# Altium project FOC.PrjPcb
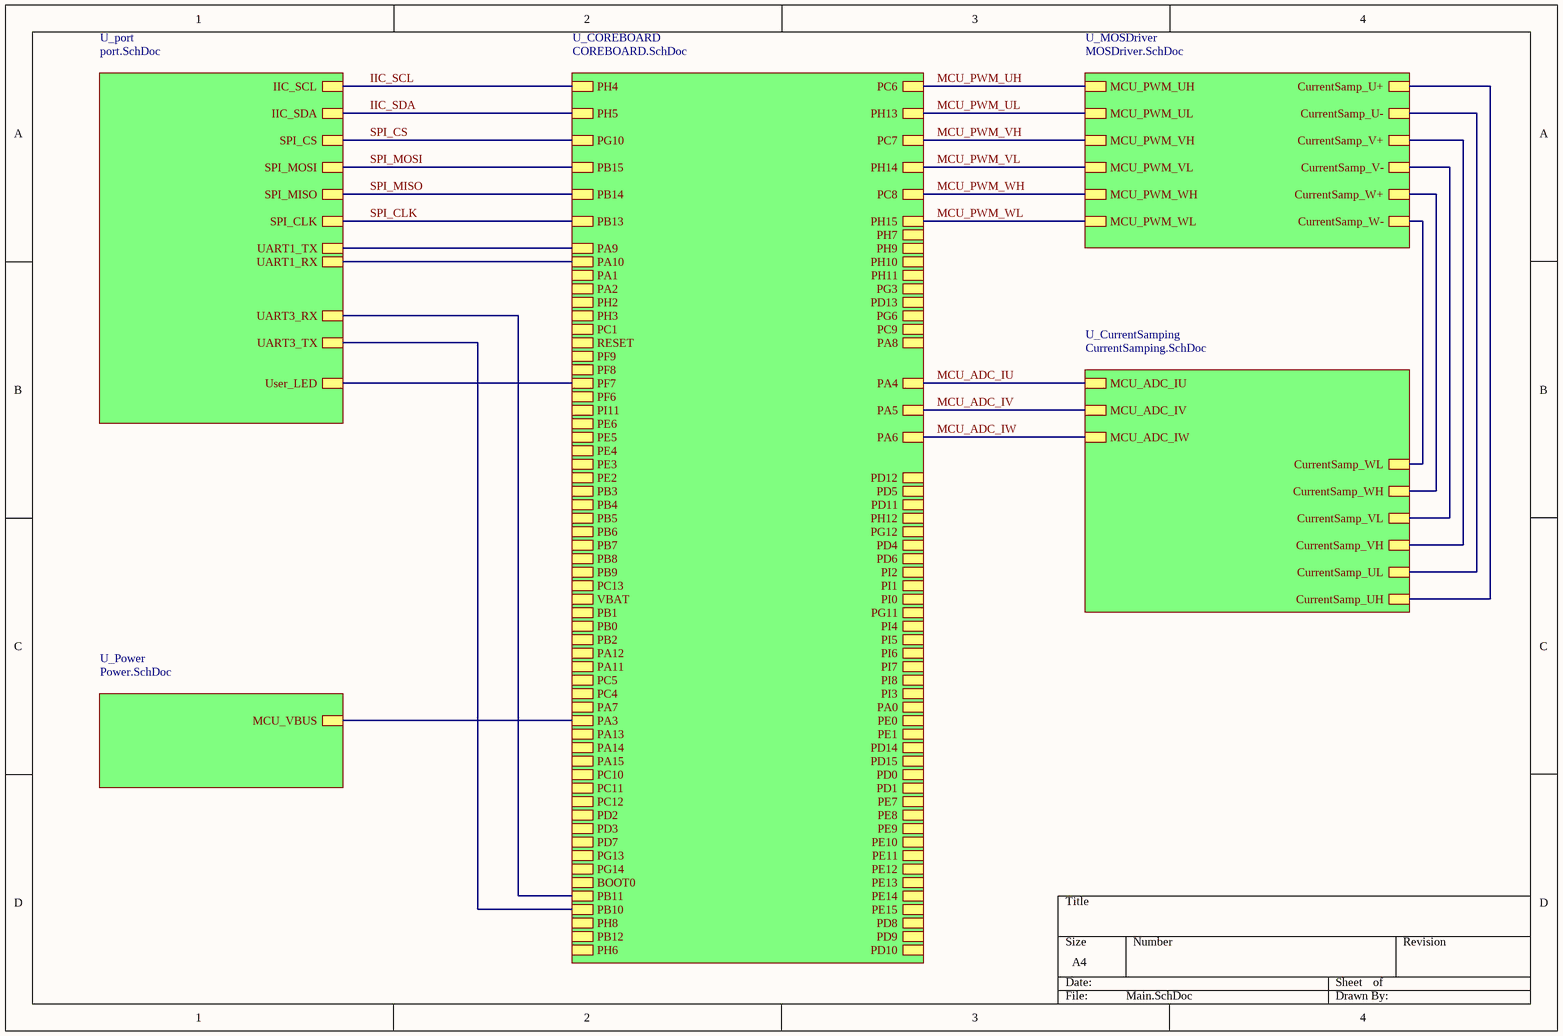
[diagram p0: Main.SchDoc]
6 sheets, 133 parts. Net scope: hierarchical (ports join the sheet entries above them; power ports are global).
Board file: FOC.PcbDoc
Sheets:
  Main.SchDoc
    U_CurrentSamping = CurrentSamping.SchDoc
    U_MOSDriver = MOSDriver.SchDoc
    U_port = port.SchDoc
    U_COREBOARD = COREBOARD.SchDoc
    U_Power = Power.SchDoc

## Sheet Main.SchDoc
size A4; SheetNumber: 1; SheetTotal: 6

### Sub-sheets
U_COREBOARD = COREBOARD.SchDoc: PA1, PA2, PH2, PH3, PH5, PH4, PC1, RESET, PF9, PF8, PF7, PF6, PI11, PE6, PE5, PE4, PE3, PE2, PB3, PB4, PB5, PB6, PB7, PB8, PB9, PC13, VBAT, PB1, PB0, PB2, PA12, PA11, PA10, PA9, PC5, PC4, PA7, PA6, PA5, PA4, PA3, PA13, PA14, PA15, PC10, PC11, PC12, PD2, PD3, PD7, PG10, PG13, PG14, BOOT0, PB11, PB10, PH8, PB12, PB13, PB14, PB15, PH6, PH7, PH9, PH10, PH11, PG3, PD13, PG6, PC6, PC7, PC8, PC9, PA8, PD12, PD5, PD11, PH12, PG12, PD4, PD6, PH15, PH14, PH13, PI2, PI1, PI0, PG11, PI4, PI5, PI6, PI7, PI8, PI3, PA0, PE0, PE1, PD14, PD15, PD0, PD1, PE7, PE8, PE9, PE10, PE11, PE12, PE13, PE14, PE15, PD8, PD9, PD10
U_CurrentSamping = CurrentSamping.SchDoc: CurrentSamp_UL, CurrentSamp_UH, MCU_ADC_IU, CurrentSamp_VL, CurrentSamp_VH, MCU_ADC_IV, CurrentSamp_WL, CurrentSamp_WH, MCU_ADC_IW
U_MOSDriver = MOSDriver.SchDoc: MCU_PWM_UH, MCU_PWM_VH, MCU_PWM_WH, MCU_PWM_UL, MCU_PWM_VL, MCU_PWM_WL, CurrentSamp_U+, CurrentSamp_U-, CurrentSamp_V+, CurrentSamp_V-, CurrentSamp_W+, CurrentSamp_W-
U_port = port.SchDoc: IIC_SCL, IIC_SDA, SPI_CS, SPI_MOSI, SPI_MISO, SPI_CLK, User_LED, UART1_RX, UART1_TX, UART3_RX, UART3_TX
U_Power = Power.SchDoc: MCU_VBUS

### Nets
IIC_SCL: sheet U_port/IIC_SCL, sheet U_COREBOARD/PH4
IIC_SDA: sheet U_port/IIC_SDA, sheet U_COREBOARD/PH5
MCU_ADC_IU: sheet U_CurrentSamping/MCU_ADC_IU, sheet U_COREBOARD/PA4
MCU_ADC_IV: sheet U_CurrentSamping/MCU_ADC_IV, sheet U_COREBOARD/PA5
MCU_ADC_IW: sheet U_CurrentSamping/MCU_ADC_IW, sheet U_COREBOARD/PA6
MCU_PWM_UH: sheet U_MOSDriver/MCU_PWM_UH, sheet U_COREBOARD/PC6
MCU_PWM_UL: sheet U_MOSDriver/MCU_PWM_UL, sheet U_COREBOARD/PH13
MCU_PWM_VH: sheet U_MOSDriver/MCU_PWM_VH, sheet U_COREBOARD/PC7
MCU_PWM_VL: sheet U_MOSDriver/MCU_PWM_VL, sheet U_COREBOARD/PH14
MCU_PWM_WH: sheet U_MOSDriver/MCU_PWM_WH, sheet U_COREBOARD/PC8
MCU_PWM_WL: sheet U_MOSDriver/MCU_PWM_WL, sheet U_COREBOARD/PH15
SPI_CLK: sheet U_port/SPI_CLK, sheet U_COREBOARD/PB13
SPI_CS: sheet U_port/SPI_CS, sheet U_COREBOARD/PG10
SPI_MISO: sheet U_port/SPI_MISO, sheet U_COREBOARD/PB14
SPI_MOSI: sheet U_port/SPI_MOSI, sheet U_COREBOARD/PB15
NetC27_1: sheet U_CurrentSamping/CurrentSamp_UL, sheet U_MOSDriver/CurrentSamp_U-
NetC27_2: sheet U_CurrentSamping/CurrentSamp_UH, sheet U_MOSDriver/CurrentSamp_U+
NetC28_1: sheet U_CurrentSamping/CurrentSamp_VL, sheet U_MOSDriver/CurrentSamp_V-
NetC28_2: sheet U_CurrentSamping/CurrentSamp_VH, sheet U_MOSDriver/CurrentSamp_V+
NetC29_1: sheet U_CurrentSamping/CurrentSamp_WH, sheet U_MOSDriver/CurrentSamp_W+
NetC29_2: sheet U_CurrentSamping/CurrentSamp_WL, sheet U_MOSDriver/CurrentSamp_W-
NetH1_2: sheet U_port/UART1_TX, sheet U_COREBOARD/PA9
NetH1_3: sheet U_port/UART1_RX, sheet U_COREBOARD/PA10
NetH2_2: sheet U_port/UART3_TX, sheet U_COREBOARD/PB10
NetH2_3: sheet U_port/UART3_RX, sheet U_COREBOARD/PB11
NetJ4_13: sheet U_port/User_LED, sheet U_COREBOARD/PF7
NetJ4_44: sheet U_COREBOARD/PA3, sheet U_Power/MCU_VBUS

## Sheet CurrentSamping.SchDoc
size A4; SheetNumber: 3; SheetTotal: 6
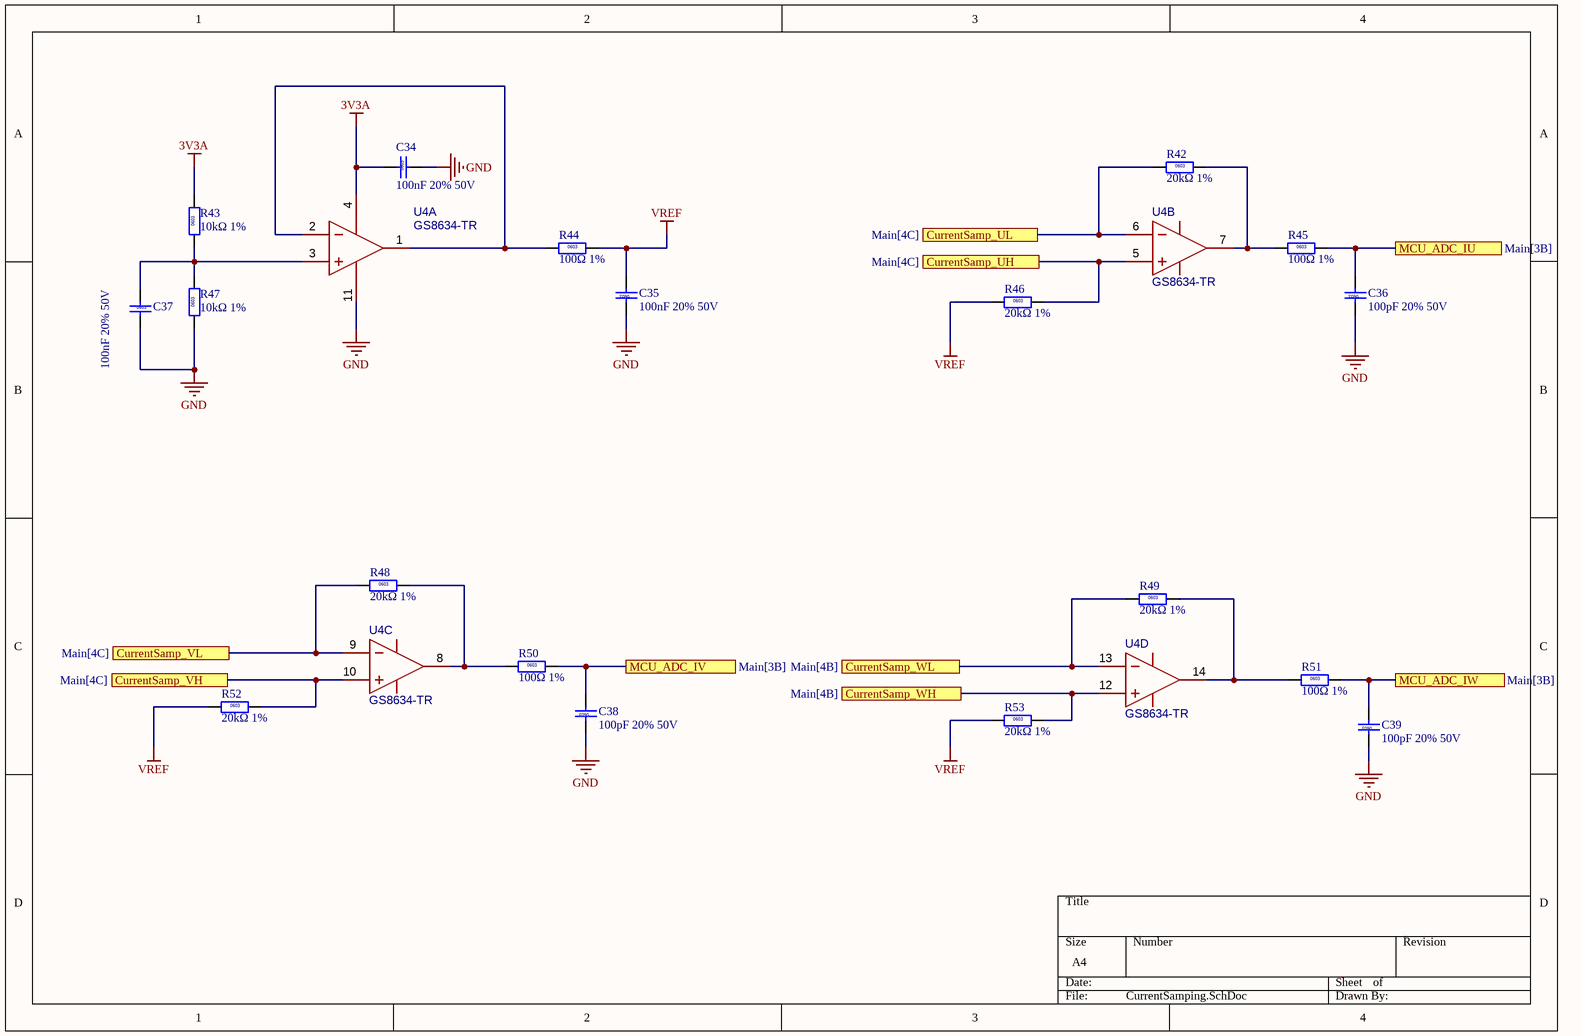
[diagram p1: CurrentSamping.SchDoc]

### Parts
C34  100nF 20% 50V  [C0603]
C35  100nF 20% 50V  [C0603]
C36  100pF 20% 50V  [C0603]
C37  100nF 20% 50V  [C0603]
C38  100pF 20% 50V  [C0603]
C39  100pF 20% 50V  [C0603]
R42  20kΩ 1%  [R0603]
R43  10kΩ 1%  [R0603]
R44  100Ω 1%  [R0603]
R45  100Ω 1%  [R0603]
R46  20kΩ 1%  [R0603]
R47  10kΩ 1%  [R0603]
R48  20kΩ 1%  [R0603]
R49  20kΩ 1%  [R0603]
R50  100Ω 1%  [R0603]
R51  100Ω 1%  [R0603]
R52  20kΩ 1%  [R0603]
R53  20kΩ 1%  [R0603]
U4  GS8634-TR  [SOP-14_L5.0-W4.4-P0.65-LS6.4-BL]  (parts A,B,C,D of 4)

### Ports
CurrentSamp_UH (see Main[4C]), CurrentSamp_UL (see Main[4C]), CurrentSamp_VH (see Main[4C]), CurrentSamp_VL (see Main[4C]), CurrentSamp_WH (see Main[4B]), CurrentSamp_WL (see Main[4B]), MCU_ADC_IU (see Main[3B]), MCU_ADC_IV (see Main[3B]), MCU_ADC_IW (see Main[3B])

### Nets
3V3A: C34.1 R43.2 U4.4(VDD)
GND: C34.2 C35.1 C36.1 C37.2 C38.1 C39.1 R47.1 U4.11(VSS)
VREF: C35.2 R44.2 R46.1 R52.1 R53.1
MCU_ADC_IU: C36.2 R45.2 ; port MCU_ADC_IU
MCU_ADC_IV: C38.2 R50.2 ; port MCU_ADC_IV
MCU_ADC_IW: C39.2 R51.2 ; port MCU_ADC_IW
NetC27_1: R42.1 U4.6(INB-) ; port CurrentSamp_UL
NetC27_2: R46.2 U4.5(INB+) ; port CurrentSamp_UH
NetC28_1: R48.1 U4.9(INC-) ; port CurrentSamp_VL
NetC28_2: R52.2 U4.10(INC+) ; port CurrentSamp_VH
NetC29_1: R53.2 U4.12(IND+) ; port CurrentSamp_WH
NetC29_2: R49.1 U4.13(IND-) ; port CurrentSamp_WL
NetC37_1: C37.1 R43.1 R47.2 U4.3(INA+)
NetR42_2: R42.2 R45.1 U4.7(OUTB)
NetR44_1: R44.1 U4.1(OUTA) U4.2(INA-)
NetR48_2: R48.2 R50.1 U4.8(OUTC)
NetR49_2: R49.2 R51.1 U4.14(OUTD)

### Notes on the sheet
- (in symbol C0603) 0603
- (in symbol R0603) 0603

### Library data of the parts
C34-C39 = C0603: 贴片电容; Package: C0603
R42-R53 = R0603: 贴片电阻; Package: R0603
U4 = GS8634-TR: 放大器数:4;轨到轨:轨到轨输入,轨到轨输出;增益带宽积(GBW):6MHz;输入失调电压(Vos):3.5mV;压摆率(SR):4.2V/us;输入偏置电流(Ib):1pA;; Manufacturer: Gainsil(聚洵); Relevance: []; AddInBom: yes; ModelId: 20b40d9ace5d4e70abc2a10921399e11聨0819f05c4eef4c71ace90d822a990e87; ModelName: SOP-14_L5.0-W4.4-H1.0-LS6.4-P0.65; ModelTransform: 236.714,196.85,0,90,0,0,0,0,0; Number of Channels: 4; Gain Bandwidth Product: 6MHz; Vos - Input Offset Voltage: 3.5mV; Input Offset Voltage Drift(Vos TC): 2.4uV/℃; Ib - Input Bias Current: 1pA; Input Voltage Noise Density: 13nV/√Hz@1kHz; Common Mode Rejection Ratio(CMRR): 90dB; Quiescent Current: 470uA; Output Current: 4mA; Single supply: 2.1V~5.5V; Dual Supply: 1.05V~2.75V；-2.75V~-1.05V; Symbol: GS8634-TR; Device: GS8634-TR; LCSC Part Name: 6MHz 轨到轨 I/O 输出，CMOS 运算放大器; SupplierPart: C157706; ManufacturerPart: GS8634-TR; Supplier Footprint: TSSOP-14; JLCPCB Part Class: Extended Part; Datasheet: https://item.szlcsc.com/datasheet/GS8634-TR/169054.html; Supplier: LCSC; ConvertToPcb: yes; FootprintName: SOP-14_L5.0-W4.4-P0.65-LS6.4-BL; Rail to Rail: 轨到轨输入,轨到轨输出; Slew Rate: 4.2V/us; Input Offset Current(Ios): 1pA; Operating Temperature: -40℃~+125℃; Features: 使能/关断功能

## Sheet MOSDriver.SchDoc
size A3; SheetNumber: 2; SheetTotal: 6
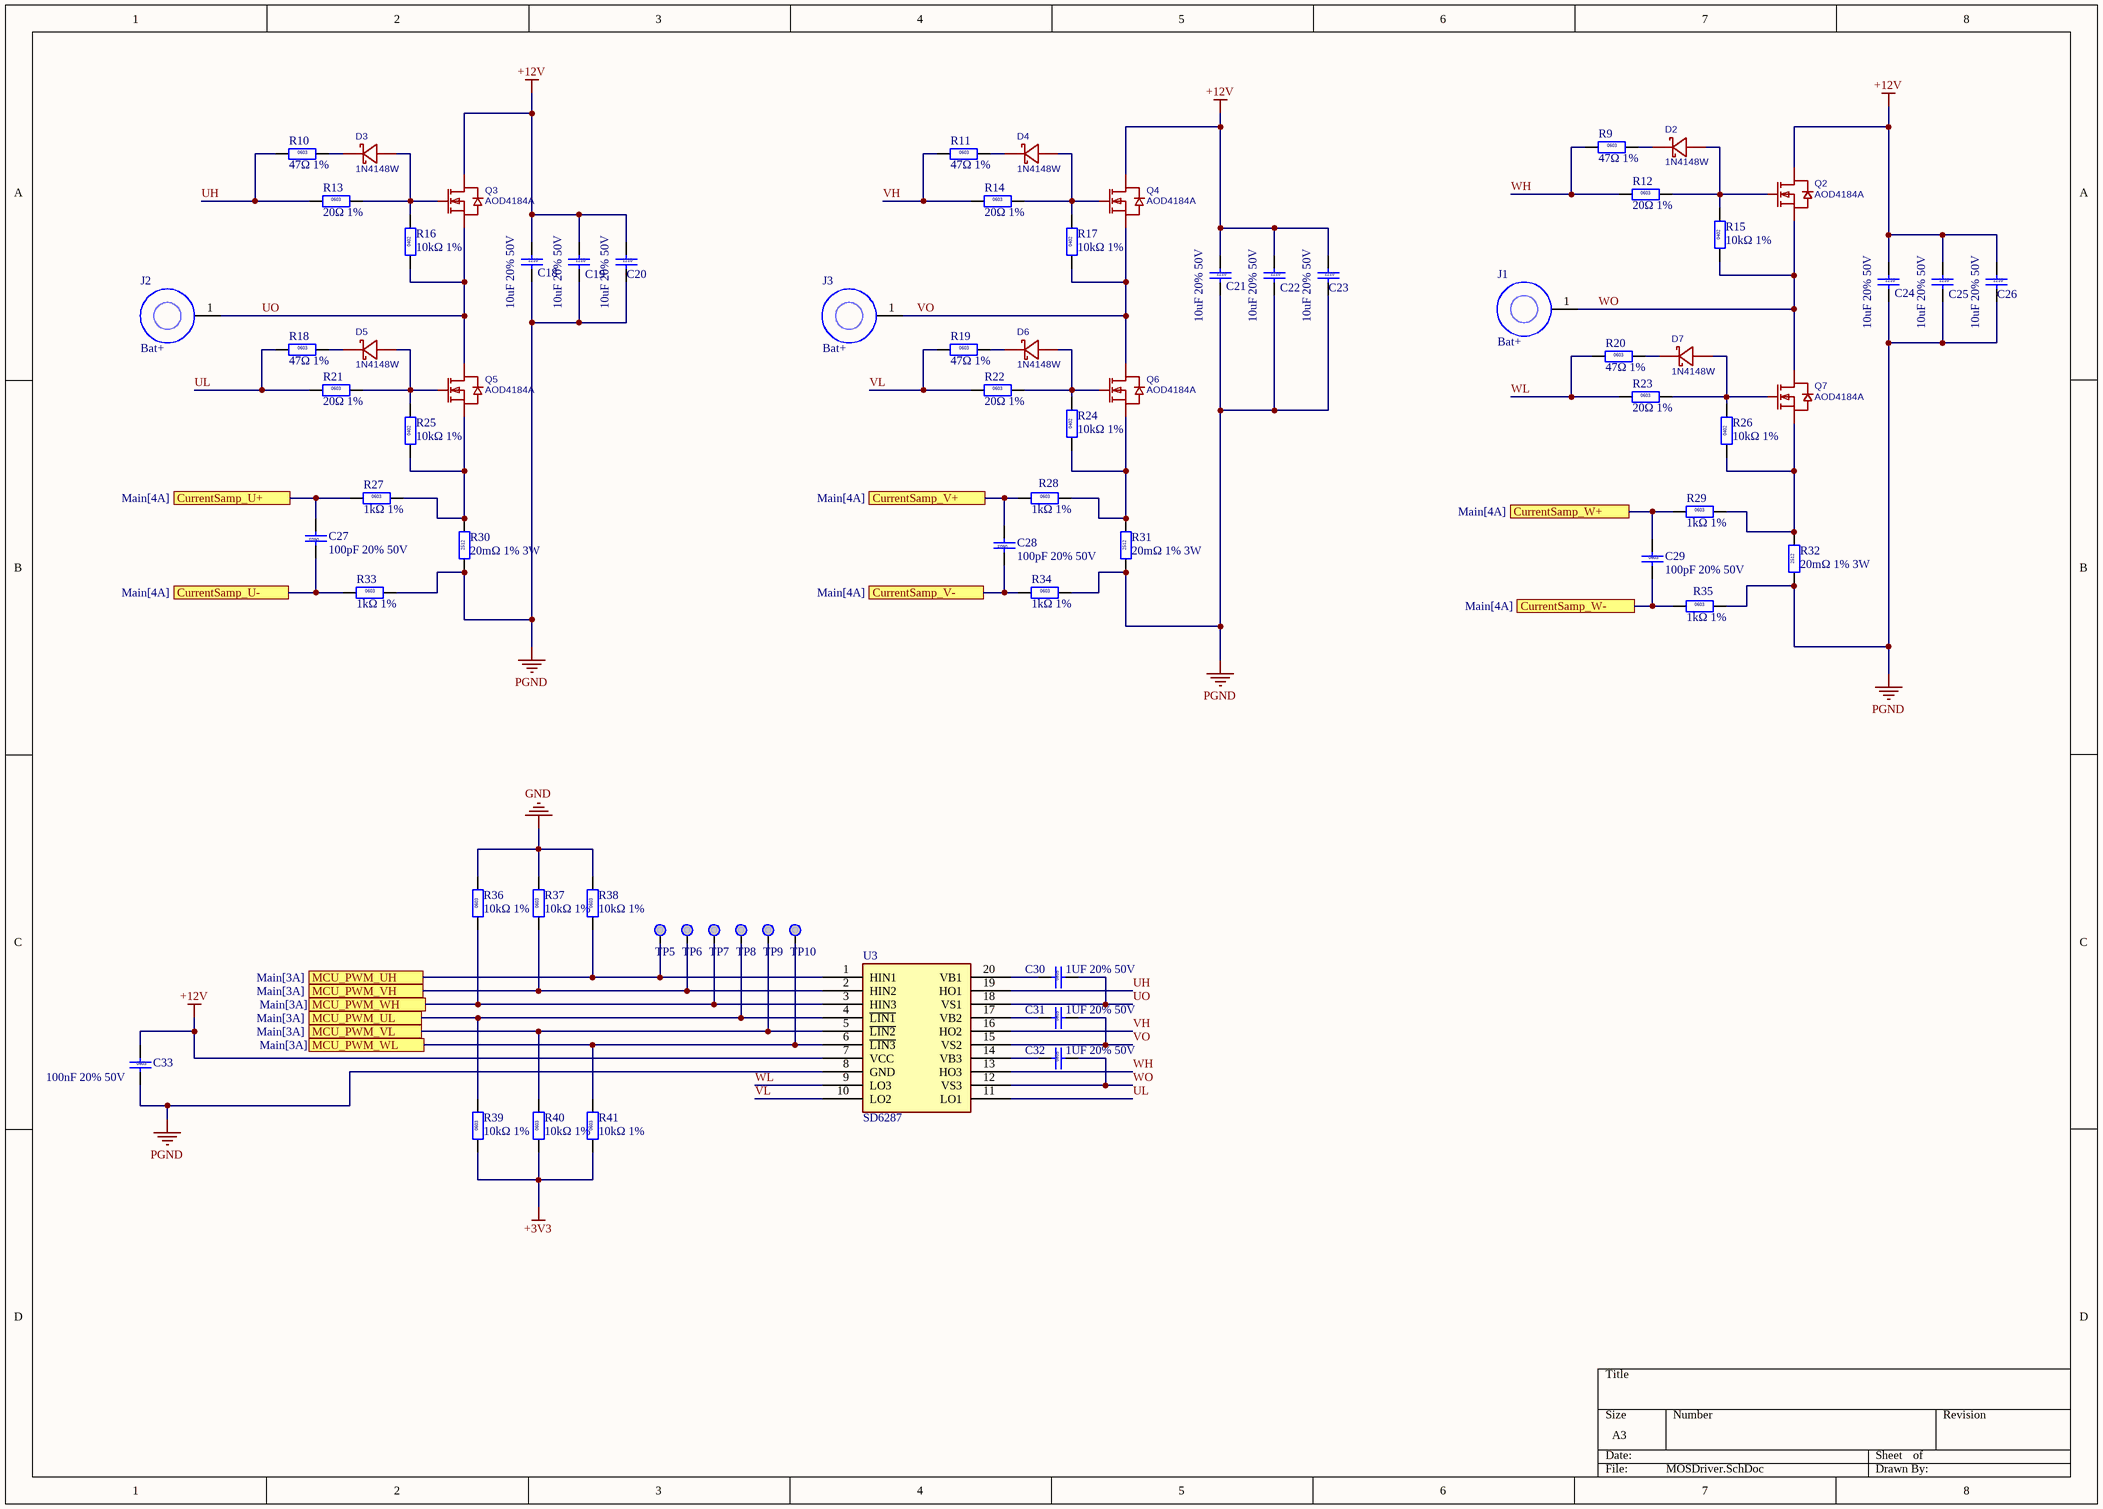
[diagram p2: MOSDriver.SchDoc]

### Parts
C18  10uF 20% 50V  [C1210]
C19  10uF 20% 50V  [C1210]
C20  10uF 20% 50V  [C1210]
C21  10uF 20% 50V  [C1210]
C22  10uF 20% 50V  [C1210]
C23  10uF 20% 50V  [C1210]
C24  10uF 20% 50V  [C1210]
C25  10uF 20% 50V  [C1210]
C26  10uF 20% 50V  [C1210]
C27  100pF 20% 50V  [C0603]
C28  100pF 20% 50V  [C0603]
C29  100pF 20% 50V  [C0603]
C30  1UF 20% 50V  [C0805]
C31  1UF 20% 50V  [C0805]
C32  1UF 20% 50V  [C0805]
C33  100nF 20% 50V  [C0603]
D2  1N4148W  [SOD-123_L2.7-W1.6-LS3.7-FD]
D3  1N4148W  [SOD-123_L2.7-W1.6-LS3.7-FD]
D4  1N4148W  [SOD-123_L2.7-W1.6-LS3.7-FD]
D5  1N4148W  [SOD-123_L2.7-W1.6-LS3.7-FD]
D6  1N4148W  [SOD-123_L2.7-W1.6-LS3.7-FD]
D7  1N4148W  [SOD-123_L2.7-W1.6-LS3.7-FD]
J1  Bat+  [VIAD1.8M1.3MM]
J2  Bat+  [VIAD1.8M1.3MM]
J3  Bat+  [VIAD1.8M1.3MM]
Q2  AOD4184A  [TO-252-2_L6.6-W6.1-P4.57-LS9.9-TL-CW]
Q3  AOD4184A  [TO-252-2_L6.6-W6.1-P4.57-LS9.9-TL-CW]
Q4  AOD4184A  [TO-252-2_L6.6-W6.1-P4.57-LS9.9-TL-CW]
Q5  AOD4184A  [TO-252-2_L6.6-W6.1-P4.57-LS9.9-TL-CW]
Q6  AOD4184A  [TO-252-2_L6.6-W6.1-P4.57-LS9.9-TL-CW]
Q7  AOD4184A  [TO-252-2_L6.6-W6.1-P4.57-LS9.9-TL-CW]
R9  47Ω 1%  [R0603]
R10  47Ω 1%  [R0603]
R11  47Ω 1%  [R0603]
R12  20Ω 1%  [R0603]
R13  20Ω 1%  [R0603]
R14  20Ω 1%  [R0603]
R15  10kΩ 1%  [R0402]
R16  10kΩ 1%  [R0402]
R17  10kΩ 1%  [R0402]
R18  47Ω 1%  [R0603]
R19  47Ω 1%  [R0603]
R20  47Ω 1%  [R0603]
R21  20Ω 1%  [R0603]
R22  20Ω 1%  [R0603]
R23  20Ω 1%  [R0603]
R24  10kΩ 1%  [R0402]
R25  10kΩ 1%  [R0402]
R26  10kΩ 1%  [R0402]
R27  1kΩ 1%  [R0603]
R28  1kΩ 1%  [R0603]
R29  1kΩ 1%  [R0603]
R30  20mΩ 1% 3W  [R2512]
R31  20mΩ 1% 3W  [R2512]
R32  20mΩ 1% 3W  [R2512]
R33  1kΩ 1%  [R0603]
R34  1kΩ 1%  [R0603]
R35  1kΩ 1%  [R0603]
R36  10kΩ 1%  [R0603]
R37  10kΩ 1%  [R0603]
R38  10kΩ 1%  [R0603]
R39  10kΩ 1%  [R0603]
R40  10kΩ 1%  [R0603]
R41  10kΩ 1%  [R0603]
TP5  TestPoint  [TP-40]  (value not drawn)  (no BOM)
TP6  TestPoint  [TP-40]  (value not drawn)  (no BOM)
TP7  TestPoint  [TP-40]  (value not drawn)  (no BOM)
TP8  TestPoint  [TP-40]  (value not drawn)  (no BOM)
TP9  TestPoint  [TP-40]  (value not drawn)  (no BOM)
TP10  TestPoint  [TP-40]  (value not drawn)  (no BOM)
U3  SD6287  [TSSOP-20]

### Ports
CurrentSamp_U+ (see Main[4A]), CurrentSamp_U- (see Main[4A]), CurrentSamp_V+ (see Main[4A]), CurrentSamp_V- (see Main[4A]), CurrentSamp_W+ (see Main[4A]), CurrentSamp_W- (see Main[4A]), MCU_PWM_UH (see Main[3A]), MCU_PWM_UL (see Main[3A]), MCU_PWM_VH (see Main[3A]), MCU_PWM_VL (see Main[3A]), MCU_PWM_WH (see Main[3A]), MCU_PWM_WL (see Main[3A])

### Nets
+3V3: R39.1 R40.1 R41.1
+12V: C18.1 C19.1 C20.1 C21.1 C22.1 C23.1 C24.1 C25.1 C26.1 C33.1 Q2.2(D) Q3.2(D) Q4.2(D) U3.7(VCC)
GND: R36.2 R37.2 R38.2
PGND: C18.2 C19.2 C20.2 C21.2 C22.2 C23.2 C24.2 C25.2 C26.2 C33.2 R30.1 R31.1 R32.1 R33.2 R34.2 R35.2 U3.8(GND)
MCU_PWM_UH: R38.1 TP5.1 U3.1(HIN1) ; port MCU_PWM_UH
MCU_PWM_UL: R39.2 TP8.1 U3.4(~{LIN1}) ; port MCU_PWM_UL
MCU_PWM_VH: R37.1 TP6.1 U3.2(HIN2) ; port MCU_PWM_VH
MCU_PWM_VL: R40.2 TP9.1 U3.5(~{LIN2}) ; port MCU_PWM_VL
MCU_PWM_WH: R36.1 TP7.1 U3.3(HIN3) ; port MCU_PWM_WH
MCU_PWM_WL: R41.2 TP10.1 U3.6(~{LIN3}) ; port MCU_PWM_WL
UH: R10.1 R13.1 U3.19(HO1)
UL: R18.1 R21.1 U3.11(LO1)
UO: C30.2 J2.1 Q3.3(S) Q5.2(D) R16.1 U3.18(VS1)
VH: R11.1 R14.1 U3.16(HO2)
VL: R19.1 R22.1 U3.10(LO2)
VO: C31.2 J3.1 Q4.3(S) Q6.2(D) R17.1 U3.15(VS2)
WH: R9.1 R12.1 U3.13(HO3)
WL: R20.1 R23.1 U3.9(LO3)
WO: C32.2 J1.1 Q2.3(S) Q7.2(D) R15.1 U3.12(VS3)
NetC27_1: C27.1 R33.1 ; port CurrentSamp_U-
NetC27_2: C27.2 R27.1 ; port CurrentSamp_U+
NetC28_1: C28.1 R34.1 ; port CurrentSamp_V-
NetC28_2: C28.2 R28.1 ; port CurrentSamp_V+
NetC29_1: C29.1 R29.1 ; port CurrentSamp_W+
NetC29_2: C29.2 R35.1 ; port CurrentSamp_W-
NetC30_1: C30.1 U3.20(VB1)
NetC31_1: C31.1 U3.17(VB2)
NetC32_1: C32.1 U3.14(VB3)
NetD2_1: D2.1(A) Q2.1(G) R12.2 R15.2
NetD2_2: D2.2(K) R9.2
NetD3_1: D3.1(A) Q3.1(G) R13.2 R16.2
NetD3_2: D3.2(K) R10.2
NetD4_1: D4.1(A) Q4.1(G) R14.2 R17.2
NetD4_2: D4.2(K) R11.2
NetD5_1: D5.1(A) Q5.1(G) R21.2 R25.2
NetD5_2: D5.2(K) R18.2
NetD6_1: D6.1(A) Q6.1(G) R22.2 R24.2
NetD6_2: D6.2(K) R19.2
NetD7_1: D7.1(A) Q7.1(G) R23.2 R26.2
NetD7_2: D7.2(K) R20.2
NetQ5_3: Q5.3(S) R25.1 R27.2 R30.2
NetQ6_3: Q6.3(S) R24.1 R28.2 R31.2
NetQ7_3: Q7.3(S) R26.1 R29.2 R32.2

### Notes on the sheet
- (in symbol C0603) 0603
- (in symbol C0805) 0805
- (in symbol R0603) 0603
- (in symbol R2512) 2512

### Library data of the parts
C18-C26 = C1210: 贴片电容; Package: 1210
C27-C29 C33 = C0603: 贴片电容; Package: C0603
C30-C32 = C0805: 贴片电容; Package: C0805
D2-D7 = 1N4148W_C7420318: 二极管配置:独立式;整流电流:150mA;直流反向耐压(Vr):100V;正向压降(Vf):1.25V@150mA;反向恢复时间(Trr):4ns;; Manufacturer: R+O(宏嘉诚); AddInBom: yes; ModelId: 5054d9b7be8b429dad093a54b517b4dd聨0819f05c4eef4c71ace90d822a990e87; ModelTransform: 145.669,61.024,0,0,0,0,0,0,0; Diode Configuration: 独立式; Pd - Power Dissipation: 400mW; Current - Rectified: 150mA; Voltage - DC Reverse(Vr): 100V; Non-Repetitive Peak Forward Surge Current: 2A; Reverse Leakage Current (Ir): 1uA@75V; Reverse Recovery Time (trr): 4ns; Operating Junction Temperature Range: -55℃~+150℃; Symbol: 1N4148W_C7420318; Device: 1N4148W_C7420318; LCSC Part Name: 100V 150mA; SupplierPart: C7420318; ManufacturerPart: 1N4148W; Supplier Footprint: SOD-123; JLCPCB Part Class: Extended Part; Datasheet: https://item.szlcsc.com/datasheet/1N4148W/8397140.html; Supplier: LCSC; ConvertToPcb: yes; FootprintName: SOD-123_L2.7-W1.6-LS3.7-FD; ModelName: SOD-123_L2.7-W1.6-LS3.7-FD; Voltage - Forward(Vf@If): 1.25V@150mA
J1-J3 = VIAHole: 通用过孔; Notepad: *
Q2-Q7 = AOD4184A: 数量:1个N沟道;漏源电压(Vdss):40V;连续漏极电流(Id):13A；50A;导通电阻(RDS(on)):7mΩ@10V;耗散功率(Pd):2.3W；50W;阈值电压(Vgs(th)):2.6V;; Manufacturer: AOS; AddInBom: yes; ModelId: ce57f84d66384067af8a68020b6de06d聨0819f05c4eef4c71ace90d822a990e87; ModelName: TO-252-2L-3P_L6.6-W6.1-H2.3-LS10.1-P4.6; ModelTransform: 259.842,390.52442,0,270,0,0,38.027,-0.598,0; Number: 1个N沟道; Drain to Source Voltage: 40V; Gate Threshold Voltage (Vgs(th)): 2.6V; Gate Charge(Qg): 33nC@10V; Input Capacitance(Ciss): 1.8nF; Reverse Transfer Capacitance (Crss@Vds): 135pF; Type: N沟道; Output Capacitance(Coss): 215pF; Vgs: ±20V; Symbol: AOD4184A; Device: AOD4184A; LCSC Part Name: 1个N沟道 耐压:40V 电流:13A 50A; SupplierPart: C99124; ManufacturerPart: AOD4184A; Supplier Footprint: TO-252; JLCPCB Part Class: Extended Part; Datasheet: https://item.szlcsc.com/datasheet/AOD4184A/100337.html; Supplier: LCSC; ConvertToPcb: yes; FootprintName: TO-252-2_L6.6-W6.1-P4.57-LS9.9-TL-CW; Current - Continuous Drain(Id): 13A；50A; RDS(on): 7mΩ@10V; Pd - Power Dissipation: 2.3W；50W; Operating Temperature: -55℃~+175℃; Configuration: -
R9-R14 R18-R23 R27-R29 R33-R41 = R0603: 贴片电阻; Package: R0603
R15-R17 R24-R26 = R0402: 贴片电阻; Package: 0402
R30-R32 = R2512: 贴片电阻; Package: R2512
TP5-TP10 = TestPoint: Test Point
U3 = SD6287: 三相独立半桥驱动芯片; Notepad: 扩展库; Package: TSSOP-20_4.4x6.5x0.65P

## Sheet port.SchDoc
size A4; SheetNumber: 4; SheetTotal: 6
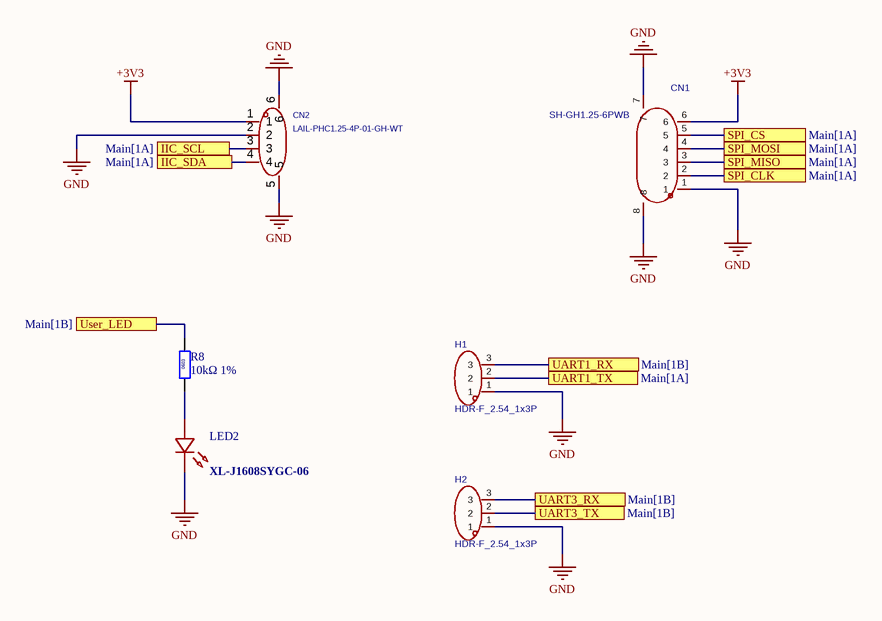
[diagram p3: port.SchDoc]

### Parts
CN1  SH-GH1.25-6PWB  [SW-SMD_SH-GH1.25-6PWB]
CN2  LAIL-PHC1.25-4P-01-GH-WT  [CONN-SMD_4P-P1.25_HCTL_HC-GH-4PWTKK]
H1  HDR-F_2.54_1x3P  [HDR-TH_3P-P2.54-V-F]
H2  HDR-F_2.54_1x3P  [HDR-TH_3P-P2.54-V-F]
LED2  XL-J1608SYGC-06  [LED0603-FD_GREEN]
R8  10kΩ 1%  [R0603]

### Ports
IIC_SCL (see Main[1A]), IIC_SDA (see Main[1A]), SPI_CLK (see Main[1A]), SPI_CS (see Main[1A]), SPI_MISO (see Main[1A]), SPI_MOSI (see Main[1A]), UART1_RX (see Main[1B]), UART1_TX (see Main[1A]), UART3_RX (see Main[1B]), UART3_TX (see Main[1B]), User_LED (see Main[1B])

### Nets
+3V3: CN1.6 CN2.1
GND: CN1.1 CN1.7 CN1.8 CN2.2 CN2.5 CN2.6 H1.1 H2.1 LED2.2(C)
IIC_SCL: CN2.3 ; port IIC_SCL
IIC_SDA: CN2.4 ; port IIC_SDA
SPI_CLK: CN1.2 ; port SPI_CLK
SPI_CS: CN1.5 ; port SPI_CS
SPI_MISO: CN1.3 ; port SPI_MISO
SPI_MOSI: CN1.4 ; port SPI_MOSI
NetH1_2: H1.2 ; port UART1_TX
NetH1_3: H1.3 ; port UART1_RX
NetH2_2: H2.2 ; port UART3_TX
NetH2_3: H2.3 ; port UART3_RX
NetJ4_13: R8.2 ; port User_LED
NetLED2_1: LED2.1(A) R8.1

### Notes on the sheet
- (in symbol R0603) 0603

### Library data of the parts
CN1 = SH-GH1.25-6PWB: 插针结构:1x6P;间距:1.25mm;安装方式:卧贴;参考系列:GH;总PIN数:6P;排数:1;每排PIN数:6;行距:-;额定电流:1A;触头材质:磷青铜;触头镀层:锡;工作温度:-25℃~+85℃;; Manufacturer: SHOU HAN(首韩); AddInBom: yes; ModelId: e09572dfa6674d54b7c86450513a2389聨0819f05c4eef4c71ace90d822a990e87; ModelTransform: 423.6212,188.976,0,0,0,0,0.001,-12.675,0; Pins Structure: 1x6P; Pitch: 1.25mm; Reference Series: GH; Number of PINs Per Row: 6; Current Rating: 1A; Voltage Rating: 125V; Plastic Material: LCP; Flame Retardant Rating: UL94V-0; Symbol: SH-GH1.25-6PWB; Device: SH-GH1.25-6PWB; LCSC Part Name: 米色 1x6P 间距:1.25mm 卧贴 系列:GH; SupplierPart: C42372473; ManufacturerPart: SH-GH1.25-6PWB; Supplier Footprint: SMD,P=1.25mm,卧贴; JLCPCB Part Class: Extended Part; Datasheet: https://item.szlcsc.com/datasheet/SH-GH1.25-6PWB/44255911.html; Supplier: LCSC; ConvertToPcb: yes; FootprintName: SW-SMD_SH-GH1.25-6PWB; ModelName: SW-SMD_SH-GH1.25-6PWB; Mounting Type: 卧贴; Number of Pins: 6P; Number of Rows: 1; Row Spacing: -; Contact Material: 磷青铜; Contact Plating: 锡; Operating Temperature: -25℃~+85℃; Supplementary Features: -; Color: 米色
CN2 = LAIL-PHC1.25-4P-01-GH-WT: 插针结构:1x4P;间距:1.25mm;安装方式:卧贴;参考系列:GH;总PIN数:4P;排数:1;每排PIN数:4;额定电流:1A;触头材质:磷青铜;触头镀层:锡;工作温度:-25℃~+85℃;; Manufacturer: LAILAN(莱联); AddInBom: yes; ModelId: be1f9715b107443eaa221cf46be59155聨0819f05c4eef4c71ace90d822a990e87; ModelTransform: 326.771,190.9445,0,0,0,0,0,-8.858,0; Pins Structure: 1x4P; Pitch: 1.25mm; Reference Series: GH; Number of PINs Per Row: 4; Current Rating: 1A; Voltage Rating: 50V; Plastic Material: LCP; Flame Retardant Rating: UL94V-0; Supplementary Features: 辅助焊脚; Z-Height of the Board: 4.4mm; X-Length of Bottom Edge on Board (Spacing Line): 8.25mm; Y-Width of Bottom Edge on Board: 4.9mm; Symbol: LAIL-PHC1.25-4P-01-GH-WT; Device: LAIL-PHC1.25-4P-01-GH-WT; LCSC Part Name: 1x4P 间距:1.25mm 卧贴 系列:GH; SupplierPart: C54905900; ManufacturerPart: LAIL-PHC1.25-4P-01-GH-WT; Supplier Footprint: SMD,P=1.25mm,卧贴; JLCPCB Part Class: Extended Part; Datasheet: https://item.szlcsc.com/datasheet/LAIL-PHC1.25-4P-01-GH-WT/58431077.html; Supplier: LCSC; ConvertToPcb: yes; FootprintName: CONN-SMD_4P-P1.25_HCTL_HC-GH-4PWTKK; ModelName: CONN-SMD_4P-P1.25_HCTL_HC-GH-4PWTKK; Mounting Type: 卧贴; Number of Pins: 4P; Number of Rows: 1; Contact Material: 磷青铜; Contact Plating: 锡; Operating Temperature: -25℃~+85℃; Color: 米黄色
H1 H2 = HDR-F_2.54_1x3P: Symbol: PM254V-11-03-H85; ConvertToPcb: yes; ModelId: f3b3cc5aae9641bf9e56fc160cef875b聨0819f05c4eef4c71ace90d822a990e87; ModelName: HDR2.54-F-LI-1X3P; ModelTransform: 299.9994,100,0,0,0,0,0,0,-118.11; Device: HDR-F_2.54_1x3P; AddInBom: yes; SupplierPart: C541850; Supplier Footprint: 插件; FootprintName: HDR-TH_3P-P2.54-V-F
LED2 = LED_0603_G: 灯头类型:1.6mmx0.8mm方形灯头;发光颜色:黄绿色;正向压降(Vf):1.9V~2.1V;功率:60mW;正向电流:20mA;波长:565nm~575nm;二极管配置:独立二极管;透镜颜色:无色透明透镜;色温:-;发光强度:80mcd;发光角度:120°;载带方式:-;工作温度:-40℃~+85℃;; Manufacturer: XINGLIGHT(成兴光); AddInBom: yes; ModelId: 1ce04384e8434edd9926301526d5d892聨0819f05c4eef4c71ace90d822a990e87; ModelTransform: 62.992,31.8897,0,0,0,0,0,0,0; Illumination Color: 黄绿色; Power(Watts): 60mW; Forward Current: 20mA; Peak Wavelength: 570nm; Diode Configuration: 独立二极管; Lens Color: 无色透明透镜; Luminous Intensity: 80mcd; Viewing Angle: 120°; Symbol: XL-J1608SYGC-06; Device: XL-J1608SYGC-06; LCSC Part Name: 0603普绿0.6T（金版）; SupplierPart: C48586672; ManufacturerPart: XL-J1608SYGC-06; Supplier Footprint: SMD; JLCPCB Part Class: Extended Part; Datasheet: https://item.szlcsc.com/datasheet/XL-J1608SYGC-06/50855282.html; Supplier: LCSC; ConvertToPcb: yes; FootprintName: LED0603-FD_GREEN; ModelName: LED0603-FD_GREEN; Lamp Holder Type: 1.6mmx0.8mm方形灯头; Voltage - Forward(Vf): 1.9V~2.1V; Wavelength - Dominant: 565nm~575nm; Color Temperature: -; Mounting Style: -; Operating Temperature: -40℃~+85℃
R8 = R0603: 贴片电阻; Package: R0603

## Sheet COREBOARD.SchDoc
size A4; SheetNumber: 6; SheetTotal: 6
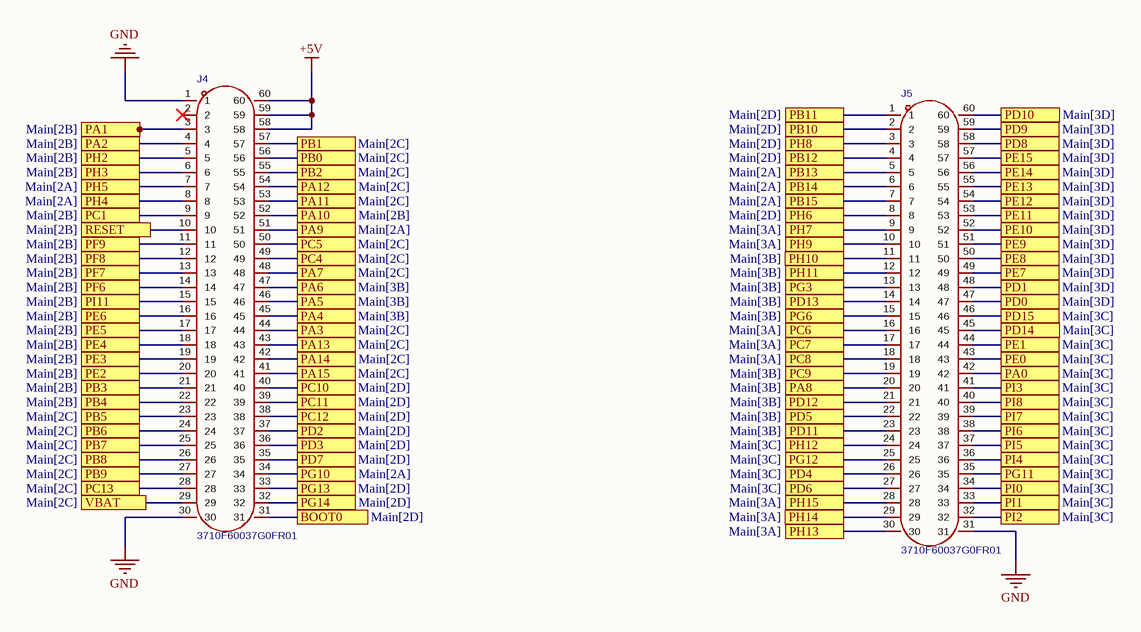
[diagram p4: COREBOARD.SchDoc]

### Parts
J4  3710F60037G0FR01  [CONN-TH_60P-P0.80_3710F60037G0FR01]
J5  3710F60037G0FR01  [CONN-TH_60P-P0.80_3710F60037G0FR01]

### Ports
BOOT0 (see Main[2D]), PA0 (see Main[3C]), PA1 (see Main[2B]), PA2 (see Main[2B]), PA3 (see Main[2C]), PA4 (see Main[3B]), PA5 (see Main[3B]), PA6 (see Main[3B]), PA7 (see Main[2C]), PA8 (see Main[3B]), PA9 (see Main[2A]), PA10 (see Main[2B]), PA11 (see Main[2C]), PA12 (see Main[2C]), PA13 (see Main[2C]), PA14 (see Main[2C]), PA15 (see Main[2C]), PB0 (see Main[2C]), PB1 (see Main[2C]), PB2 (see Main[2C]), PB3 (see Main[2B]), PB4 (see Main[2B]), PB5 (see Main[2C]), PB6 (see Main[2C]), PB7 (see Main[2C]), PB8 (see Main[2C]), PB9 (see Main[2C]), PB10 (see Main[2D]), PB11 (see Main[2D]), PB12 (see Main[2D]), PB13 (see Main[2A]), PB14 (see Main[2A]), PB15 (see Main[2A]), PC1 (see Main[2B]), PC4 (see Main[2C]), PC5 (see Main[2C]), PC6 (see Main[3A]), PC7 (see Main[3A]), PC8 (see Main[3A]), PC9 (see Main[3B]), PC10 (see Main[2D]), PC11 (see Main[2D]), PC12 (see Main[2D]), PC13 (see Main[2C]), PD0 (see Main[3D]), PD1 (see Main[3D]), PD2 (see Main[2D]), PD3 (see Main[2D]), PD4 (see Main[3C]), PD5 (see Main[3B]), PD6 (see Main[3C]), PD7 (see Main[2D]), PD8 (see Main[3D]), PD9 (see Main[3D]), PD10 (see Main[3D]), PD11 (see Main[3B]), PD12 (see Main[3B]), PD13 (see Main[3B]), PD14 (see Main[3C]), PD15 (see Main[3C]), PE0 (see Main[3C]), PE1 (see Main[3C]), PE2 (see Main[2B]), PE3 (see Main[2B]), PE4 (see Main[2B]), PE5 (see Main[2B]), PE6 (see Main[2B]), PE7 (see Main[3D]), PE8 (see Main[3D]), PE9 (see Main[3D]), PE10 (see Main[3D]), PE11 (see Main[3D]), PE12 (see Main[3D]), PE13 (see Main[3D]), PE14 (see Main[3D]), PE15 (see Main[3D]), PF6 (see Main[2B]), PF7 (see Main[2B]), PF8 (see Main[2B]), PF9 (see Main[2B]), PG3 (see Main[3B]), PG6 (see Main[3B]), PG10 (see Main[2A]), PG11 (see Main[3C]), PG12 (see Main[3C]), PG13 (see Main[2D]), PG14 (see Main[2D]), PH2 (see Main[2B]), PH3 (see Main[2B]), PH4 (see Main[2A]), PH5 (see Main[2A]), PH6 (see Main[2D]), PH7 (see Main[3A]), PH8 (see Main[2D]), PH9 (see Main[3A]), PH10 (see Main[3B]), PH11 (see Main[3B]), PH12 (see Main[3C]), PH13 (see Main[3A]), PH14 (see Main[3A]), PH15 (see Main[3A]), PI0 (see Main[3C]), PI1 (see Main[3C]), PI2 (see Main[3C]), PI3 (see Main[3C]), PI4 (see Main[3C]), PI5 (see Main[3C]), PI6 (see Main[3C]), PI7 (see Main[3C]), PI8 (see Main[3C]), PI11 (see Main[2B]), RESET (see Main[2B]), VBAT (see Main[2C])

### Nets
+5V: J4.58 J4.59 J4.60
GND: J4.1 J4.30 J5.31
IIC_SCL: J4.8 ; port PH4
IIC_SDA: J4.7 ; port PH5
MCU_ADC_IU: J4.45 ; port PA4
MCU_ADC_IV: J4.46 ; port PA5
MCU_ADC_IW: J4.47 ; port PA6
MCU_PWM_UH: J5.16 ; port PC6
MCU_PWM_UL: J5.30 ; port PH13
MCU_PWM_VH: J5.17 ; port PC7
MCU_PWM_VL: J5.29 ; port PH14
MCU_PWM_WH: J5.18 ; port PC8
MCU_PWM_WL: J5.28 ; port PH15
SPI_CLK: J5.5 ; port PB13
SPI_CS: J4.34 ; port PG10
SPI_MISO: J5.6 ; port PB14
SPI_MOSI: J5.7 ; port PB15
NetH1_2: J4.51 ; port PA9
NetH1_3: J4.52 ; port PA10
NetH2_2: J5.2 ; port PB10
NetH2_3: J5.1 ; port PB11
NetJ4_3: J4.3 ; port PA1
NetJ4_4: J4.4 ; port PA2
NetJ4_5: J4.5 ; port PH2
NetJ4_6: J4.6 ; port PH3
NetJ4_9: J4.9 ; port PC1
NetJ4_10: J4.10 ; port RESET
NetJ4_11: J4.11 ; port PF9
NetJ4_12: J4.12 ; port PF8
NetJ4_13: J4.13 ; port PF7
NetJ4_14: J4.14 ; port PF6
NetJ4_15: J4.15 ; port PI11
NetJ4_16: J4.16 ; port PE6
NetJ4_17: J4.17 ; port PE5
NetJ4_18: J4.18 ; port PE4
NetJ4_19: J4.19 ; port PE3
NetJ4_20: J4.20 ; port PE2
NetJ4_21: J4.21 ; port PB3
NetJ4_22: J4.22 ; port PB4
NetJ4_23: J4.23 ; port PB5
NetJ4_24: J4.24 ; port PB6
NetJ4_25: J4.25 ; port PB7
NetJ4_26: J4.26 ; port PB8
NetJ4_27: J4.27 ; port PB9
NetJ4_28: J4.28 ; port PC13
NetJ4_29: J4.29 ; port VBAT
NetJ4_31: J4.31 ; port BOOT0
NetJ4_32: J4.32 ; port PG14
NetJ4_33: J4.33 ; port PG13
NetJ4_35: J4.35 ; port PD7
NetJ4_36: J4.36 ; port PD3
NetJ4_37: J4.37 ; port PD2
NetJ4_38: J4.38 ; port PC12
NetJ4_39: J4.39 ; port PC11
NetJ4_40: J4.40 ; port PC10
NetJ4_41: J4.41 ; port PA15
NetJ4_42: J4.42 ; port PA14
NetJ4_43: J4.43 ; port PA13
NetJ4_44: J4.44 ; port PA3
NetJ4_48: J4.48 ; port PA7
NetJ4_49: J4.49 ; port PC4
NetJ4_50: J4.50 ; port PC5
NetJ4_53: J4.53 ; port PA11
NetJ4_54: J4.54 ; port PA12
NetJ4_55: J4.55 ; port PB2
NetJ4_56: J4.56 ; port PB0
NetJ4_57: J4.57 ; port PB1
NetJ5_3: J5.3 ; port PH8
NetJ5_4: J5.4 ; port PB12
NetJ5_8: J5.8 ; port PH6
NetJ5_9: J5.9 ; port PH7
NetJ5_10: J5.10 ; port PH9
NetJ5_11: J5.11 ; port PH10
NetJ5_12: J5.12 ; port PH11
NetJ5_13: J5.13 ; port PG3
NetJ5_14: J5.14 ; port PD13
NetJ5_15: J5.15 ; port PG6
NetJ5_19: J5.19 ; port PC9
NetJ5_20: J5.20 ; port PA8
NetJ5_21: J5.21 ; port PD12
NetJ5_22: J5.22 ; port PD5
NetJ5_23: J5.23 ; port PD11
NetJ5_24: J5.24 ; port PH12
NetJ5_25: J5.25 ; port PG12
NetJ5_26: J5.26 ; port PD4
NetJ5_27: J5.27 ; port PD6
NetJ5_32: J5.32 ; port PI2
NetJ5_33: J5.33 ; port PI1
NetJ5_34: J5.34 ; port PI0
NetJ5_35: J5.35 ; port PG11
NetJ5_36: J5.36 ; port PI4
NetJ5_37: J5.37 ; port PI5
NetJ5_38: J5.38 ; port PI6
NetJ5_39: J5.39 ; port PI7
NetJ5_40: J5.40 ; port PI8
NetJ5_41: J5.41 ; port PI3
NetJ5_42: J5.42 ; port PA0
NetJ5_43: J5.43 ; port PE0
NetJ5_44: J5.44 ; port PE1
NetJ5_45: J5.45 ; port PD14
NetJ5_46: J5.46 ; port PD15
NetJ5_47: J5.47 ; port PD0
NetJ5_48: J5.48 ; port PD1
NetJ5_49: J5.49 ; port PE7
NetJ5_50: J5.50 ; port PE8
NetJ5_51: J5.51 ; port PE9
NetJ5_52: J5.52 ; port PE10
NetJ5_53: J5.53 ; port PE11
NetJ5_54: J5.54 ; port PE12
NetJ5_55: J5.55 ; port PE13
NetJ5_56: J5.56 ; port PE14
NetJ5_57: J5.57 ; port PE15
NetJ5_58: J5.58 ; port PD8
NetJ5_59: J5.59 ; port PD9
NetJ5_60: J5.60 ; port PD10

Not connected (* = marked no-connect by the designer): J4 2*

### Library data of the parts
J4 J5 = 3710F60037G0FR01: AddInBom: yes; ModelId: ea88157e74564cd790d3fb822bd5b75b聨0819f05c4eef4c71ace90d822a990e87; ModelTransform: 1170.864,236.22,0,0,0,0,-0.003,0.006,-27.559; Symbol: 3710F60037G0FR01; Device: 3710F60037G0FR01; LCSC Part Name: 3710F60037G0FR01; SupplierPart: C9900157213; ManufacturerPart: 3710F60037G0FR01; Supplier Footprint: SMD,P=0.8mm; JLCPCB Part Class: Extended Part; Supplier: LCSC; ConvertToPcb: yes; FootprintName: CONN-TH_60P-P0.80_3710F60037G0FR01; ModelName: CONN-TH_60P-P0.80_3710F60037G0FR01

## Sheet Power.SchDoc
size A4; SheetNumber: 5; SheetTotal: 6
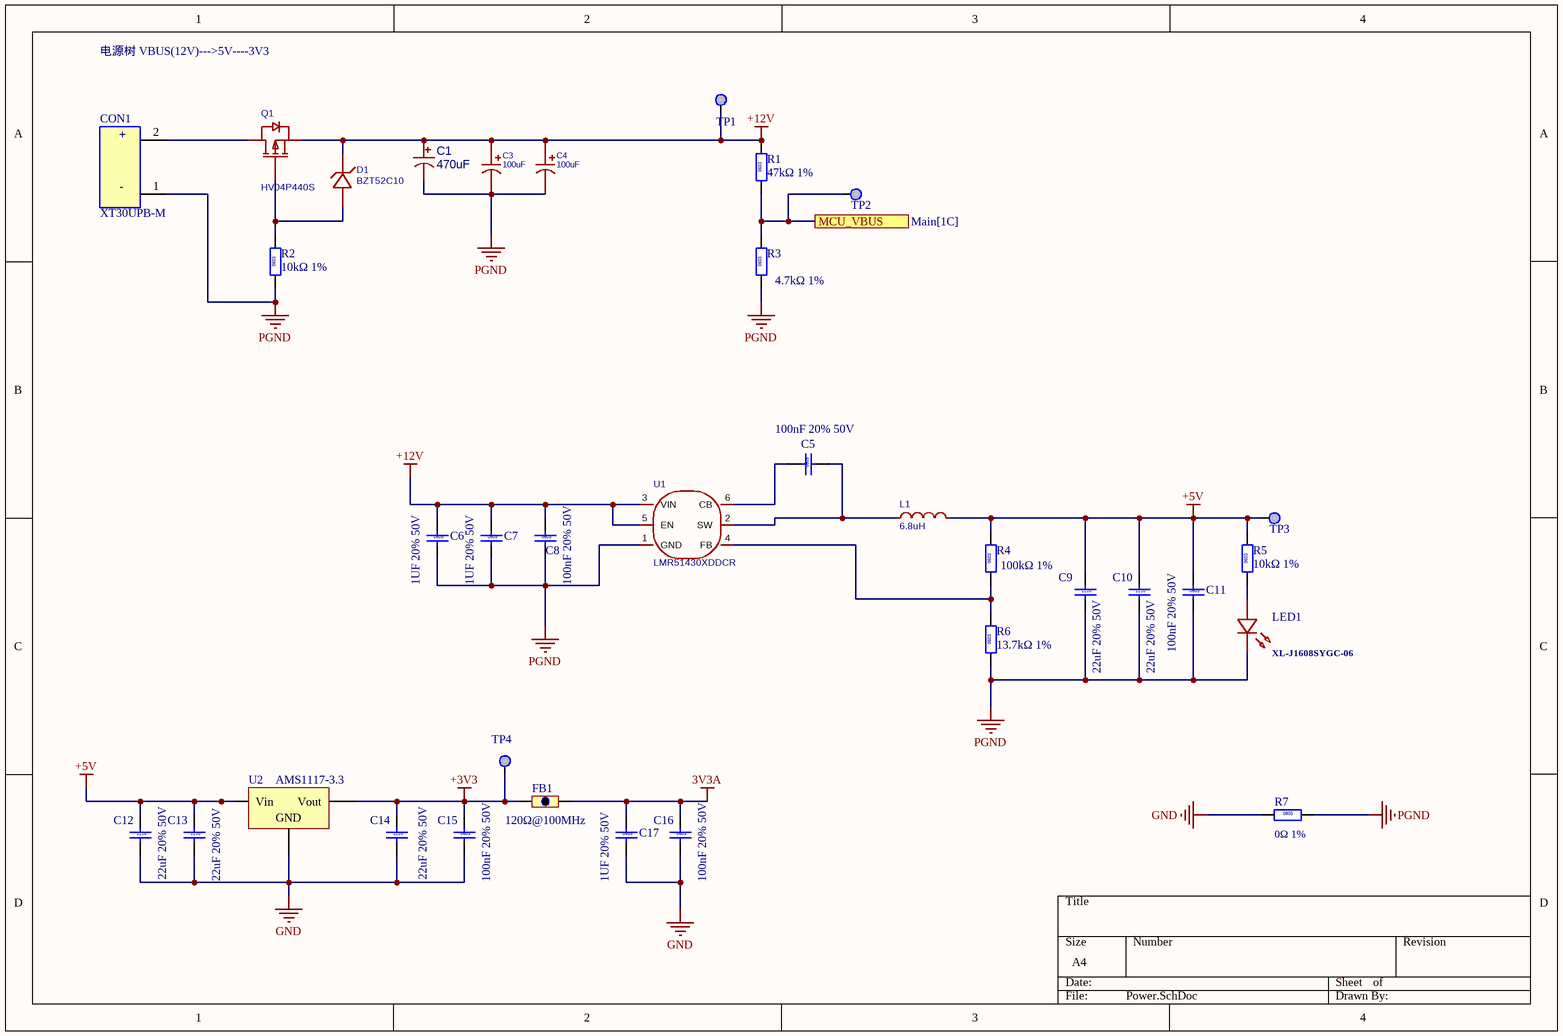
[diagram p5: Power.SchDoc]

### Parts
C1  470uF  [CAP-SMD_BD10.0-L10.3-W10.3-LS11.0-R-RD]
C3  100uF  [CAP-SMD_BD6.3-L6.6-W6.6-LS7.2-FD_3]
C4  100uF  [CAP-SMD_BD6.3-L6.6-W6.6-LS7.2-FD_3]
C5  100nF 20% 50V  [C0603]
C6  1UF 20% 50V  [C0805]
C7  1UF 20% 50V  [C0805]
C8  100nF 20% 50V  [C0603]
C9  22uF 20% 50V  [C1210]
C10  22uF 20% 50V  [C1210]
C11  100nF 20% 50V  [C0603]
C12  22uF 20% 50V  [C1210]
C13  22uF 20% 50V  [C1210]
C14  22uF 20% 50V  [C1210]
C15  100nF 20% 50V  [C0603]
C16  100nF 20% 50V  [C0603]
C17  1UF 20% 50V  [C0805]
CON1  XT30UPB-M  [CONN-TH_XT30UPB-M]
D1  BZT52C10  [SOD-123_L2.8-W1.8-LS3.7-RD]
FB1  120Ω@100MHz  [FB_0603]
L1  6.8uH  [IND-SMD_L7.0-W6.6]
LED1  XL-J1608SYGC-06  [LED0603-FD_GREEN]
Q1  HV04P440S  [SOT-89-3_L4.5-W2.4-P1.50-LS4.0-BR]
R1  47kΩ 1%  [R0603]
R2  10kΩ 1%  [R0603]
R3  4.7kΩ 1%  [R0603]
R4  100kΩ 1%  [R0603]
R5  10kΩ 1%  [R0603]
R6  13.7kΩ 1%  [R0603]
R7  0Ω 1%  [R0805]
TP1  TestPoint  [TP-40]  (value not drawn)  (no BOM)
TP2  TestPoint  [TP-40]  (value not drawn)  (no BOM)
TP3  TestPoint  [TP-40]  (value not drawn)  (no BOM)
TP4  TestPoint  [TP-40]  (value not drawn)  (no BOM)
U1  LMR51430XDDCR  [SOT-23-6_L2.9-W1.6-P0.95-LS2.8-BL]
U2  AMS1117-3.3  [SOT-223]

### Ports
MCU_VBUS (see Main[1C])

### Nets
3V3A: C16.1 C17.1 FB1.2
+3V3: C14.1 C15.1 FB1.1 TP4.1 U2.2(Vout)
+5V: C9.1 C10.1 C11.1 C12.1 C13.1 L1.2 R4.2 R5.2 TP3.1 U2.3(Vin)
+12V: C1.1 C3.1 C4.1 C6.1 C7.1 C8.1 D1.1(K) Q1.3(S) R1.2 TP1.1 U1.3(VIN) U1.5(EN)
GND: C12.2 C13.2 C14.2 C15.2 C16.2 C17.2 R7.1 U2.1(GND)
PGND: C1.2 C3.2 C4.2 C6.2 C7.2 C8.2 C9.2 C10.2 C11.2 CON1.1 LED1.2(C) R2.1 R3.1 R6.1 R7.2 U1.1(GND)
NetC5_1: C5.1 U1.6(CB)
NetC5_2: C5.2 L1.1 U1.2(SW)
NetCON1_2: CON1.2 Q1.2(D)
NetD1_2: D1.2(A) Q1.1(G) R2.2
NetJ4_44: R1.1 R3.2 TP2.1 ; port MCU_VBUS
NetLED1_1: LED1.1(A) R5.1
NetR4_1: R4.1 R6.2 U1.4(FB)

### Notes on the sheet
- 电源树 VBUS(12V)--->5V----3V3
- (in symbol C0603) 0603
- (in symbol C0805) 0805
- (in symbol R0603) 0603
- (in symbol R0805) 0805
- (in symbol XT30UPB-M) +; -

### Library data of the parts
C1 = 470UF: 容值:470uF;精度:±20%;额定电压:35V;纹波电流:286mA@120Hz;等效串联电阻(ESR):-;; Manufacturer: ROQANG(容强); ManufacturerPart: RVT1V471M1010; Symbol: RVT1V471M1010-C72519; Device: RVT1V471M1010_C72519; AddInBom: yes; ModelId: 1ded6976ebcc49a492e53070078a8da6聨0819f05c4eef4c71ace90d822a990e87; ModelName: CAP-SMD_BD10.0-L10.3-W10.3-LS11.3-FD-1; ModelTransform: 444.881,405.511,0,180,0,0,0,0,0; Tolerance: ±20%; Voltage Rating: 35V; Lifetime: 2000hrs@105℃; LCSC Part Name: 470uF ±20% 35V; SupplierPart: C72519; Supplier Footprint: SMD,D10xL10.2mm; JLCPCB Part Class: Extended Part; Datasheet: https://atta.szlcsc.com/upload/public/pdf/source/20210128/C72519_A1B8ED607B11AD36B70B1D23AFC8819E.pdf; Supplier: LCSC; ConvertToPcb: yes; FootprintName: CAP-SMD_BD10.0-L10.3-W10.3-LS11.0-R-RD; Value: 470uF; Ripple Current: 286mA@120Hz; Equivalent Series Resistance(ESR): -; Diameter: 10mm; Height - Seated (Max): 10.2mm; Operating Temperature: -40℃~+105℃
C3 C4 = 100UF: 容值:100uF;精度:±20%;额定电压:35V;纹波电流:90mA@120Hz;等效串联电阻(ESR):-;; Manufacturer: KNSCHA(科尼盛); Symbol: RVT100UF35V34RV0158; Device: VT100UF35V34RV0158; AddInBom: yes; ModelId: 0fb5a32acd664192a8ced5dba101c72a聨0819f05c4eef4c71ace90d822a990e87; ModelName: CAP-SMD_BD6.3-L6.6-W6.6-H5.4-LS7.2-FD; ModelTransform: 283.464,259.842,0,0,0,0,0,0,0; Tolerance: ±20%; Voltage Rating: 35V; Lifetime: 2000hrs@105℃; LCSC Part Name: 100uF ±20% 35V; SupplierPart: C2887272; ManufacturerPart: VT100UF35V34RV0158; Supplier Footprint: SMD,D6.3xL5.4mm; JLCPCB Part Class: Extended Part; Datasheet: https://item.szlcsc.com/datasheet/VT100UF35V34RV0158/3103840.html; Supplier: LCSC; ConvertToPcb: yes; FootprintName: CAP-SMD_BD6.3-L6.6-W6.6-LS7.2-FD_3; Value: 100uF; Ripple Current: 90mA@120Hz; Equivalent Series Resistance(ESR): -; Diameter: 6.3mm; Height - Seated (Max): 5.4mm; Operating Temperature: -55℃~+105℃
C5 C8 C11 C15 C16 = C0603: 贴片电容; Package: C0603
C6 C7 C17 = C0805: 贴片电容; Package: C0805
C9 C10 C12-C14 = C1210: 贴片电容; Package: 1210
CON1 = XT30UPB-M: 电源连接器/插头 15A 500VDC
D1 = BZT52C10_C2103: 二极管配置:1个独立式;稳压值(标称值):10V;稳压值(范围):9.4V~10.6V;耗散功率(Pd):500mW;; Manufacturer: CJ(江苏长电/长晶); AddInBom: yes; ModelId: 7884390a25fb4c08947731ebfba7e3f8聨0819f05c4eef4c71ace90d822a990e87; ModelTransform: 144.8816,62.992,0,0,0,0,0,0,0; Diode Configuration: 1个独立式; Zener Voltage(Nom): 10V; Reverse Leakage Current (Ir): 200nA; Pd - Power Dissipation: 500mW; Impedance(Zzt): 20Ω; Impedance(Zzk): 150Ω; Operating Junction Temperature Range: -55℃~+150℃; Symbol: BZT52C10; Device: BZT52C10_C2103; LCSC Part Name: 独立式 耐压:10V 电流:0.2uA; SupplierPart: C2103; ManufacturerPart: BZT52C10; Supplier Footprint: SOD-123; JLCPCB Part Class: Extended Part; Datasheet: https://item.szlcsc.com/datasheet/BZT52C10/2460.html; Supplier: LCSC; ConvertToPcb: yes; FootprintName: SOD-123_L2.8-W1.8-LS3.7-RD; ModelName: SOD-123_L2.8-W1.8-LS3.7-RD; Zener Voltage(Range): 9.4V~10.6V; Tolerance: -
FB1 = FB_0603: 磁珠  阻抗@频率 220Ω@100MHz / 误差 ±25% 直流电阻(DCR) 50mΩ / 额定电流 2.2A  工作温度 -55℃~+125℃; Value: 220Ω@100MHz; Package: 0603; SuppliersPartNumber: C88980
L1 = MWSA0603S-6R8MT: 电感值:6.8uH;精度:±20%;额定电流:5A;饱和电流(Isat):6A;类型:-;; Manufacturer: Sunlord(顺络); AddInBom: yes; ModelId: 6860c29aec394a38a0f014af7f722a42聨0819f05c4eef4c71ace90d822a990e87; ModelName: IND-SMD_L7.0-W6.6-H3.0; ModelTransform: 275.59,259.88137,0,0,0,0,0,0,0; Tolerance: ±20%; Current Rating: 5A; Current - Saturation(Isat): 6A; DC Resistance(DCR): 48mΩ; Symbol: MWSA0603S-6R8MT; Device: MWSA0603S-6R8MT; LCSC Part Name: 6.8uH ±20% 6A; SupplierPart: C408449; ManufacturerPart: MWSA0603S-6R8MT; Supplier Footprint: SMD,7x6.6mm; JLCPCB Part Class: Extended Part; Datasheet: https://item.szlcsc.com/datasheet/MWSA0603S-6R8MT/397801.html; Supplier: LCSC; ConvertToPcb: yes; FootprintName: IND-SMD_L7.0-W6.6; Value: 6.8uH; Type: -; Ratings: -
LED1 = LED_0603_G: as LED2 on sheet port; Symbol: XL-J1608SYGC-06; Device: XL-J1608SYGC-06; LCSC Part Name: 0603普绿0.6T（金版）; SupplierPart: C48586672; ManufacturerPart: XL-J1608SYGC-06; Supplier Footprint: SMD; JLCPCB Part Class: Extended Part; Datasheet: https://item.szlcsc.com/datasheet/XL-J1608SYGC-06/50855282.html; Supplier: LCSC; ConvertToPcb: yes; FootprintName: LED0603-FD_GREEN; ModelName: LED0603-FD_GREEN; Lamp Holder Type: 1.6mmx0.8mm方形灯头; Voltage - Forward(Vf): 1.9V~2.1V; Wavelength - Dominant: 565nm~575nm; Color Temperature: -; Mounting Style: -; Operating Temperature: -40℃~+85℃
Q1 = HV04P440S: 数量:1个P沟道;漏源电压(Vdss):40V;连续漏极电流(Id):6A;导通电阻(RDS(on)):32mΩ@10V；42mΩ@4.5V;耗散功率(Pd):2.5W;阈值电压(Vgs(th)):1.7V;; Manufacturer: R+O(宏嘉诚); AddInBom: yes; ModelId: dde435042bae4b9691e74da94cf9d9f3聨0819f05c4eef4c71ace90d822a990e87; ModelTransform: 177.165,161.417,0,90,0,0,-2.323,0,0; Number: 1个P沟道; Drain to Source Voltage: 40V; Current - Continuous Drain(Id): 6A; Pd - Power Dissipation: 2.5W; Gate Threshold Voltage (Vgs(th)): 1.7V; Gate Charge(Qg): 23nC@10V; Input Capacitance(Ciss): 1.25nF; Reverse Transfer Capacitance (Crss@Vds): 80pF; Type: P沟道; Output Capacitance(Coss): 98pF; Symbol: HV04P440S; Device: HV04P440S; LCSC Part Name: P沟道MOSFET; SupplierPart: C49256781; ManufacturerPart: HV04P440S; Supplier Footprint: SOT-89; JLCPCB Part Class: Extended Part; Datasheet: https://item.szlcsc.com/datasheet/HV04P440S/51692181.html; Supplier: LCSC; ConvertToPcb: yes; FootprintName: SOT-89-3_L4.5-W2.4-P1.50-LS4.0-BR; ModelName: SOT-89-3_L4.5-W2.4-P1.50-LS4.0-BR; RDS(on): 32mΩ@10V；42mΩ@4.5V; Operating Temperature: -55℃~+150℃; Configuration: -
R1-R6 = R0603: 贴片电阻; Package: R0603
R7 = R0805: 贴片电阻; Package: R0805
TP1-TP4 = TestPoint: Test Point
U1 = LMR51430XDDCR: 功能类型:降压型;工作电压:4.5V~36V;输出电压:600mV~34.2V;输出电流:3A;输出类型:可调;; Manufacturer: TI(德州仪器); AddInBom: yes; ModelId: 18da8f6c14a34920b3e136b5c401a119聨0819f05c4eef4c71ace90d822a990e87; ModelName: SOT-23-6_L2.9-W1.6-H1.5-LS2.8-P0.95; ModelTransform: 110.236,113.364,0,90,0,0,0.0005,0.0005,0; Function: 降压型; Output Current: 3A; Frequency - Switching: 500kHz; Synchronous Rectifier: 是; Number of Outputs: 1; Topology: 降压式; Quiescent Current: 40uA; Switch tube (built-in/external): 内置; Output Type: 可调; Symbol: LMR51430XDDCR; Device: LMR51430XDDCR; LCSC Part Name: 降压型 3A 4.5V~36V; SupplierPart: C5185863; ManufacturerPart: LMR51430XDDCR; Supplier Footprint: SOT-23-6; JLCPCB Part Class: Extended Part; Datasheet: https://item.szlcsc.com/datasheet/LMR51430XDDCR/5856347.html; Supplier: LCSC; ConvertToPcb: yes; FootprintName: SOT-23-6_L2.9-W1.6-P0.95-LS2.8-BL; Voltage - Supply: 4.5V~36V; Output Voltage: 600mV~34.2V; Operating Temperature: -40℃~+150℃@(TJ); Features: 轻载高效模式；逐波限流；过流保护；打嗝限流
U2 = AMS1117-3.3: AMS1117系列可调及固定电压稳压器的设计目标是提供高达1A的输出电流，且能在输入 - 输出压差低至1V的条件下工作。该器件的压差保证最大为1.3V，在负载电流较低时会降低。片上调校功能可将参考电压调整至±1.5%

## Nets that join several sheets
3V3A: CurrentSamping (C34.1 R43.2 U4.4), Power (C16.1 C17.1 FB1.2)
+3V3: MOSDriver (R39.1 R40.1 R41.1), port (CN1.6 CN2.1), Power (5 pins)
+5V: COREBOARD (J4.58 J4.59 J4.60), Power (10 pins)
+12V: MOSDriver (14 pins), Power (12 pins)
GND: CurrentSamping (8 pins), MOSDriver (R36.2 R37.2 R38.2), port (9 pins), COREBOARD (J4.1 J4.30 J5.31), Power (8 pins)
PGND: MOSDriver (17 pins), Power (16 pins)
IIC_SCL: port (CN2.3), COREBOARD (J4.8)
IIC_SDA: port (CN2.4), COREBOARD (J4.7)
MCU_ADC_IU: CurrentSamping (C36.2 R45.2), COREBOARD (J4.45)
MCU_ADC_IV: CurrentSamping (C38.2 R50.2), COREBOARD (J4.46)
MCU_ADC_IW: CurrentSamping (C39.2 R51.2), COREBOARD (J4.47)
MCU_PWM_UH: MOSDriver (R38.1 TP5.1 U3.1), COREBOARD (J5.16)
MCU_PWM_UL: MOSDriver (R39.2 TP8.1 U3.4), COREBOARD (J5.30)
MCU_PWM_VH: MOSDriver (R37.1 TP6.1 U3.2), COREBOARD (J5.17)
MCU_PWM_VL: MOSDriver (R40.2 TP9.1 U3.5), COREBOARD (J5.29)
MCU_PWM_WH: MOSDriver (R36.1 TP7.1 U3.3), COREBOARD (J5.18)
MCU_PWM_WL: MOSDriver (R41.2 TP10.1 U3.6), COREBOARD (J5.28)
NetC27_1: CurrentSamping (R42.1 U4.6), MOSDriver (C27.1 R33.1)
NetC27_2: CurrentSamping (R46.2 U4.5), MOSDriver (C27.2 R27.1)
NetC28_1: CurrentSamping (R48.1 U4.9), MOSDriver (C28.1 R34.1)
NetC28_2: CurrentSamping (R52.2 U4.10), MOSDriver (C28.2 R28.1)
NetC29_1: CurrentSamping (R53.2 U4.12), MOSDriver (C29.1 R29.1)
NetC29_2: CurrentSamping (R49.1 U4.13), MOSDriver (C29.2 R35.1)
NetH1_2: port (H1.2), COREBOARD (J4.51)
NetH1_3: port (H1.3), COREBOARD (J4.52)
NetH2_2: port (H2.2), COREBOARD (J5.2)
NetH2_3: port (H2.3), COREBOARD (J5.1)
NetJ4_13: port (R8.2), COREBOARD (J4.13)
NetJ4_44: COREBOARD (J4.44), Power (R1.1 R3.2 TP2.1)
SPI_CLK: port (CN1.2), COREBOARD (J5.5)
SPI_CS: port (CN1.5), COREBOARD (J4.34)
SPI_MISO: port (CN1.3), COREBOARD (J5.6)
SPI_MOSI: port (CN1.4), COREBOARD (J5.7)